# Altium schematic sheet CANBUS.SchDoc
size A; SheetNumber: 4; SheetTotal: 7
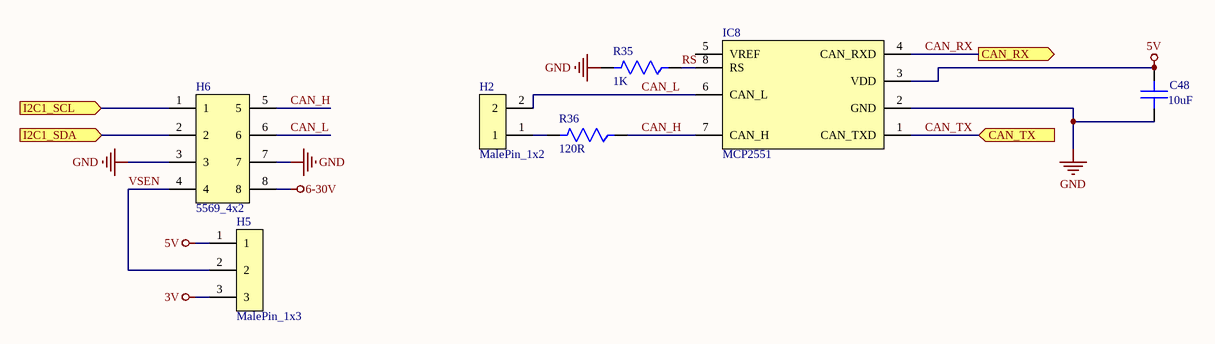
[diagram p0: CANBUS.SchDoc]

## Parts
C48  10uF  [C0603]
H2  MalePin_1x2  [MALEPIN_1x2]
H5  MalePin_1x3  [MALEPIN_1x3]
H6  5569_4x2  [5569_4x2]
IC8  MCP2551  [SOIC-8]
R35  1K  [R0603]
R36  120R  [R0603]

## Ports
CAN_RX (out, see DeoCaProjectV3.1[2B], MCU[3B]), CAN_TX (in, see DeoCaProjectV3.1[2B], MCU[3B]), I2C1_SCL (in, see DeoCaProjectV3.1[2B], MCU[3B]), I2C1_SDA (in, see DeoCaProjectV3.1[2B], MCU[3B])

## Nets
3V: H5.3
5V: C48.1 H5.1 IC8.3(VDD)
6-30V: H6.8
GND: C48.2 H6.3 H6.7 IC8.2(GND) R35.2
CAN_H: H6.5 IC8.7(CAN_H) R36.1
CAN_L: H2.2 H6.6 IC8.6(CAN_L)
CAN_RX: IC8.4(CAN_RXD) ; port CAN_RX
CAN_TX: IC8.1(CAN_TXD) ; port CAN_TX
I2C1_SCL: H6.1 ; port I2C1_SCL
I2C1_SDA: H6.2 ; port I2C1_SDA
RS: IC8.8(RS) R35.1
VSEN: H5.2 H6.4
NetH2_1: H2.1 R36.2

Not connected (* = marked no-connect by the designer): IC8 5(VREF)

## Library data of the parts
C48 = Capacitor
R35 R36 = Resistor: SMD Resistor 0603; Manufacturer: Yageo; Manufacturer Part Number: RC0603FR-071KL; Power Rating: 100mW; Tolerance: 1%; Value: 1kR; Temperature Coefficient: 100ppm/°C; Voltage Rating: 50V; Supplier: Digi-Key; Supplier Part Number: 311-1.00KHRDKR-ND; RoHS: Yes; Category: Chip SMD Resistors; Stock: 18662657; Pricing: 1=0.1, 10=0.018, 50=0.0106, 100=0.0088, 500=0.00592, 1000=0.00505 (USD); Case/Package: 0603; Case Code (Imperial): 0603; Case Code (Metric): 1608; Contact Plating: Tin,Matte; Min Operating Temperature: -55°C; Max Operating Temperature: 155°C; Packaging: Tape and Reel; Resistor Type: Thick Film; Termination: SMD/SMT; Features: Moisture Resistant; Series: RC; Max Power Dissipation: 100mW; Number of Terminations: 2; Resistance Tolerance: 1%; Construction: Rectangular; Technology: THICK FILM; Length: 1.6mm; Height: 0.45mm; Depth: 0.8mm; Reach SVHC Compliant: No; Military Standard: Not; Lead Free: 5697LeadFree; RoHS Compliant: Yes